# Altium project ESP32_F.PrjPcb
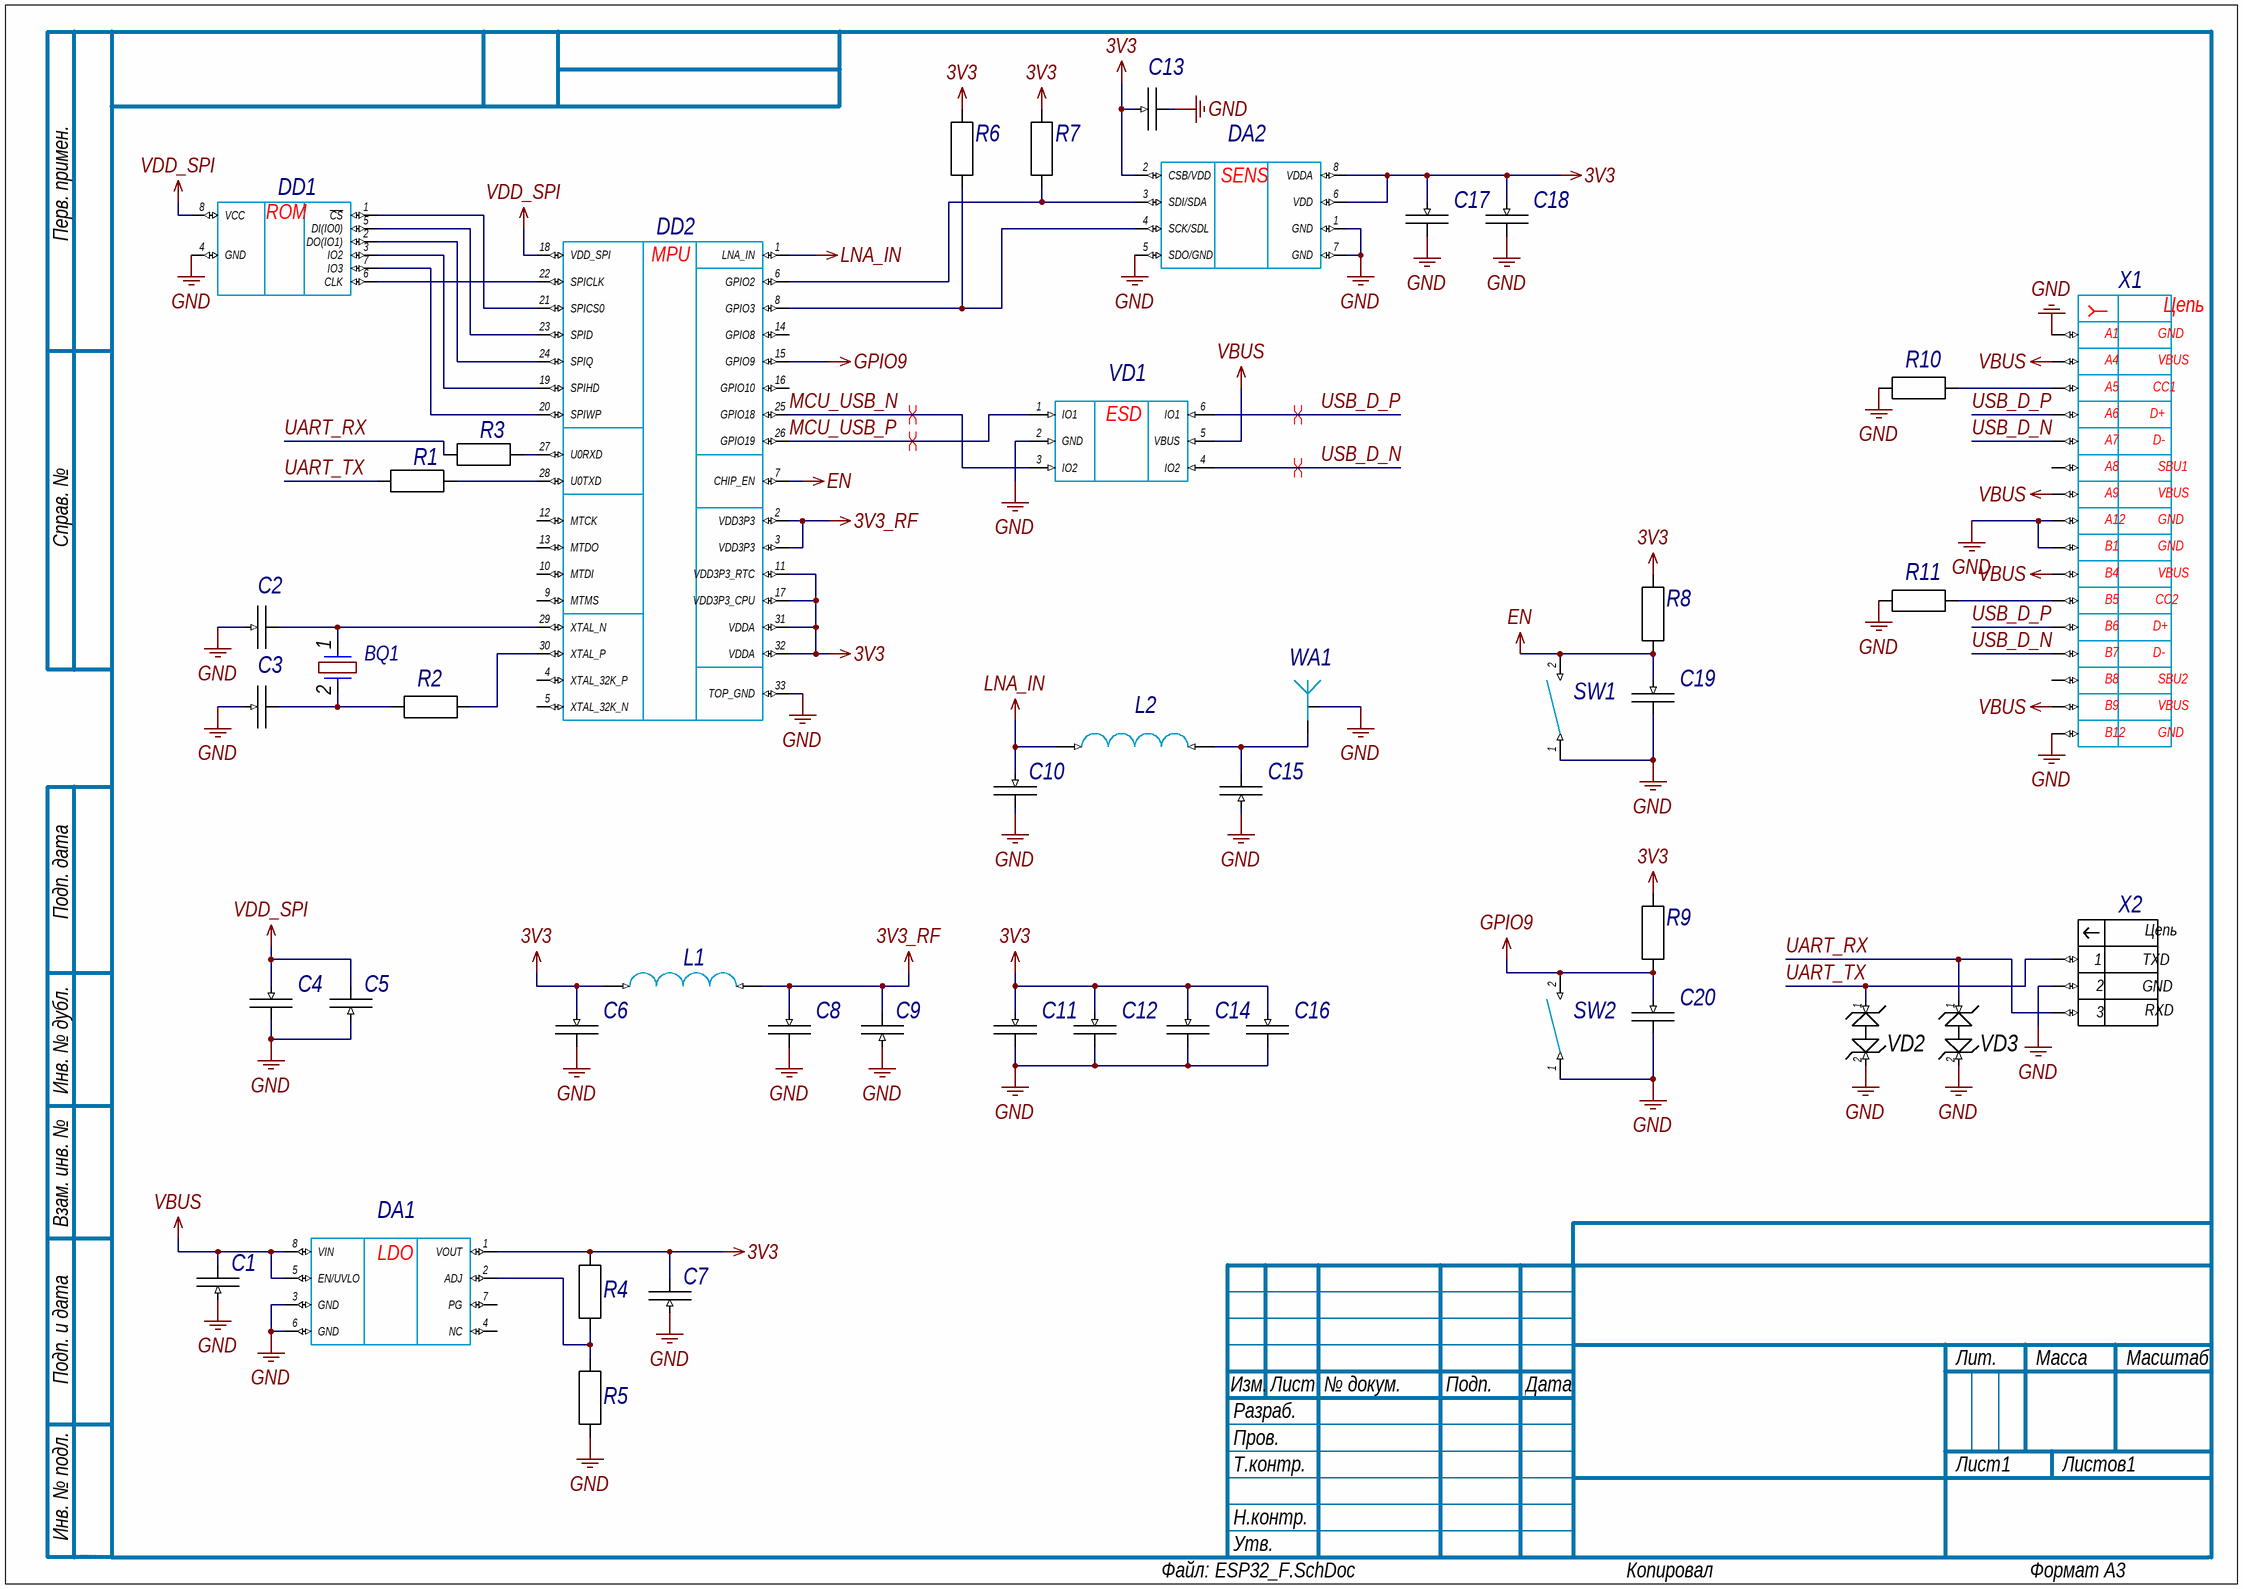
[diagram p0: ESP32_F.SchDoc]
1 sheet, 46 parts. Net scope: global (net labels, ports and power ports of the same name join across sheets).
Board file: ESP32_F.PcbDoc

## Sheet ESP32_F.SchDoc
size 420 x 297 mm; Author: ALTIUM GOSTBOM2.0 KEV; SheetNumber: 1; SheetTotal: 1

### Parts
BQ1  ABM3-40.000MHZ-B2-T  [ABM3]  (value not drawn)
C1  C_0402  [C_0402]  (value not drawn)
C2  C_0402  [C_0402]  (value not drawn)
C3  C_0402  [C_0402]  (value not drawn)
C4  C_0402  [C_0402]  (value not drawn)
C5  C_0805  [C_0805]  (value not drawn)
C6  C_0402  [C_0402]  (value not drawn)
C7  C_0402  [C_0402]  (value not drawn)
C8  C_0402  [C_0402]  (value not drawn)
C9  C_0805  [C_0805]  (value not drawn)
C10  C_0402  [C_0402]  (value not drawn)
C11  C_0402  [C_0402]  (value not drawn)
C12  C_0402  [C_0402]  (value not drawn)
C13  C_0402  [C_0402]  (value not drawn)
C14  C_0402  [C_0402]  (value not drawn)
C15  C_0402  [C_0402]  (value not drawn)
C16  C_0402  [C_0402]  (value not drawn)
C17  C_0402  [C_0402]  (value not drawn)
C18  C_0402  [C_0402]  (value not drawn)
C19  C_0402  [C_0402]  (value not drawn)
C20  C_0402  [C_0402]  (value not drawn)
DA1  ADP7104ACPZ-R7  [SON50P300X300X80-9N-D]  (value not drawn)
DA2  BME680  [LGA-8]  (value not drawn)
DD1  W25Q64JVSSIQ  [SOIC127P790X216-8N]  (value not drawn)
DD2  ESP32-C3  [QFN50P500X500X90-33N-D]  (value not drawn)
L1  L_0805  [L_0402]  (value not drawn)
L2  L_0402  [L_0402]  (value not drawn)
R1  R_0402  [R_0402]  (value not drawn)
R2  R_0402  [R_0402]  (value not drawn)
R3  R_0402  [R_0402]  (value not drawn)
R4  R_0402  [R_0402]  (value not drawn)
R5  R_0402  [R_0402]  (value not drawn)
R6  R_0402  [R_0402]  (value not drawn)
R7  R_0402  [R_0402]  (value not drawn)
R8  R_0402  [R_0402]  (value not drawn)
R9  R_0402  [R_0402]  (value not drawn)
R10  R_0402  [R_0402]  (value not drawn)
R11  R_0402  [R_0402]  (value not drawn)
SW1  DS04-254-2-01BK-SMT-TR  [DS04-254-2-01BK-SMT-TR]  (value not drawn)
SW2  DS04-254-2-01BK-SMT-TR  [DS04-254-2-01BK-SMT-TR]  (value not drawn)
VD1  USBLC6-2SC6  [SOT95P280X145-6N]  (value not drawn)
VD2  TPD1E10B06DPY  [TPD1E10B06DPYR]  (value not drawn)
VD3  TPD1E10B06DPY  [TPD1E10B06DPYR]  (value not drawn)
WA1  IFA  [F_antenna]  (value not drawn)
X1  GSB1C41110SSHR  [GSB1C41110SSHR]  (value not drawn)
X2  3pin_JST  [BM03BSRSSTB]  (value not drawn)

### Nets
3V3: C6.1 C7.2 C11.1 C12.1 C13.1 C14.1 C16.1 C17.1 C18.1 DA1.1(VOUT) DA2.2(CSB/VDD) DA2.6(VDD) DA2.8(VDDA) DD2.11(VDD3P3_RTC) DD2.17(VDD3P3_CPU) DD2.31(VDDA) DD2.32(VDDA) L1.1 R4.2 R6.1 R7.1 R8.1 R9.1
3V3_RF: C8.1 C9.2 DD2.2(VDD3P3) DD2.3(VDD3P3) L1.2
EN: C19.1 DD2.7(CHIP_EN) R8.2 SW1.2
GND: C1.1 C2.1 C3.1 C4.2 C5.1 C6.2 C7.1 C8.2 C9.1 C10.2 C11.2 C12.2 C13.2 C14.2 C15.1 C16.2 C17.2 C18.2 C19.2 C20.2 DA1.3(GND) DA1.6(GND) DA2.1(GND) DA2.5(SDO/GND) DA2.7(GND) DD1.4(GND) DD2.33(TOP_GND) R5.1 R10.2 R11.2 SW1.1 SW2.1 VD1.2(GND) VD2.2 VD3.2 WA1.2(GND) X1.A1(GND) X1.A12(GND) X1.B1(GND) X1.B12(GND) X2.2(GND)
GPIO9: C20.1 DD2.15(GPIO9) R9.2 SW2.2
LNA_IN: C10.1 DD2.1(LNA_IN) L2.1
VBUS: C1.2 DA1.5(EN/UVLO) DA1.8(VIN) VD1.5(VBUS) X1.A4(VBUS) X1.A9(VBUS) X1.B4(VBUS) X1.B9(VBUS)
VDD_SPI: C4.1 C5.2 DD1.8(VCC) DD2.18(VDD_SPI)
MCU_USB_N: DD2.25(GPIO18) VD1.3(IO2)
MCU_USB_P: DD2.26(GPIO19) VD1.1(IO1)
UART_RX: R3.1 VD3.1 X2.3(RXD)
UART_TX: R1.1 VD2.1 X2.1(TXD)
USB_D_N: VD1.4(IO2) X1.A7(D-) X1.B7(D-)
USB_D_P: VD1.6(IO1) X1.A6(D+) X1.B6(D+)
NetBQ1_1: BQ1.1 C2.2 DD2.29(XTAL_N)
NetBQ1_2: BQ1.2 C3.2 R2.1
NetC15_2: C15.2 L2.2 WA1.1
NetDA1_2: DA1.2(ADJ) R4.1 R5.2
NetDA2_3: DA2.3(SDI/SDA) DD2.6(GPIO2) R7.2
NetDA2_4: DA2.4(SCK/SDL) DD2.8(GPIO3) R6.2
NetDD1_1: DD1.1(~{CS}) DD2.21(SPICS0)
NetDD1_2: DD1.2(DO(IO1)) DD2.24(SPIQ)
NetDD1_3: DD1.3(IO2) DD2.19(SPIHD)
NetDD1_5: DD1.5(DI(IO0)) DD2.23(SPID)
NetDD1_6: DD1.6(CLK) DD2.22(SPICLK)
NetDD1_7: DD1.7(IO3) DD2.20(SPIWP)
NetDD2_27: DD2.27(U0RXD) R3.2
NetDD2_28: DD2.28(U0TXD) R1.2
NetDD2_30: DD2.30(XTAL_P) R2.2
NetR10_1: R10.1 X1.A5(CC1)
NetR11_1: R11.1 X1.B5(CC2)

Not connected (* = marked no-connect by the designer): DA1 4(NC) 7(PG); DD2 4(XTAL_32K_P) 5(XTAL_32K_N) 9(MTMS) 10(MTDI) 12(MTCK) 13(MTDO) 14(GPIO8) 16(GPIO10); X1 A8(SBU1) B8(SBU2)

### Layout directives
differential pair: MCU_USB_N, MCU_USB_P, USB_D_N, USB_D_P

### Notes on the sheet
- Перв. примен.
- Справ. №
- Подп. дата
- Инв. № дубл.
- Взам. инв. №
- Подп. и дата
- Изм.
- Разраб.
- Лист
- № докум.
- Подп.
- Дата
- Лит.
- Масса
- Масштаб
- Пров.
- Т.контр.
- Листов
- Инв. № подл.
- Н.контр.
- Утв.
- ALTIUM GOSTBOM2.0 KEV
- Файл:
- Копировал
- Формат А3
- (in symbol 3pin_JST) Цепь
- (in symbol ADP7104ACPZ-R7) LDO
- (in symbol BME680) SENS
- (in symbol ESP32-C3) MPU
- (in symbol GSB1C41110SSHR) Цепь
- (in symbol USBLC6-2SC6) ESD
- (in symbol W25Q64JVSSIQ) ROM

### Library data of the parts
BQ1 = ABM3-40.000MHZ-B2-T: Crystal or Oscillator; Manufacturer_Name: ABRACON; Datasheet Link: https://abracon.com/Resonators/abm3.pdf; Height: 1.3mm; Manufacturer_Part_Number: ABM3-40.000MHZ-B2-T
C1 C7 = C_0402: Capacitor generic 0402 smd; Manufacturer: Kyecera AVX; Part_number: CM105X7R105K25AT; Tolerance: 10; Voltage_rating: 25; Dielecric: X7R; Value: 1uF; Package_size: 0402
C2 C3 = C_0402: Capacitor generic 0402 smd; Manufacturer: Murata; Part_number: GJM0225C1C220GB01L; Tolerance: 2%; Voltage_rating: 16; Dielecric: C0G(NP0); Value: 22pF; Package_size: 0402
C4 C6 C8 C11-C14 C16-C20 = C_0402: Capacitor generic 0402 smd; Manufacturer: Yageo; Part_number: AC0402KRX7R8BB104; Tolerance: 10; Voltage_rating: 25; Dielecric: X7R; Value: 100nF; Package_size: 0402
C5 C9 = C_0805: Capacitor generic 0805 smd; Manufacturer: Yageo; Part_number: CC0805KKX7R7BB106; Tolerance: 10; Voltage_rating: 16; Dielecric: X7R; Value: 10uF; Package_size: 0805
C10 = C_0402: Capacitor generic 0402 smd; Manufacturer: Murata; Part_number: GJM0225C1E5R0BB01L; Tolerance: 0.1pF; Voltage_rating: 25; Dielecric: C0G(NP0); Value: 5pF; Package_size: 0402
C15 = C_0402: Capacitor generic 0402 smd; Manufacturer: Murata; Part_number: GJM0225C1E4R0BB01L; Tolerance: 0.1pF; Voltage_rating: 25; Dielecric: C0G(NP0); Value: 4pF; Package_size: 0402
DA1 = ADP7104ACPZ-R7: CMOS LDO 500mA / input V 3.3V - 20V / output V 1.5 -9 V; Manufactur: Analog Devices; Part_number: ADP7104ACPZ-R7
DA2 = BME680: Low power gas, pressure, temperature & humidity / sensor; Manufacturer: Bosch; Parameter 2: BME680
DD1 = W25Q64JVSSIQ: NOR Flash (SPI, Dual SPI, Quad SPI); Manufacturer: Winbond Electronics; Part_number: W25Q64JVSSIQ
DD2 = ESP32-C3: MCU (SoC) with wifi & bluetooth support; Manufacturer: Espressif; Part_number: ESP32-C3
L1 = L_0805: induction 0805 smd; Manufacturer: Murata; Part_number: LQW15AN2N2C10D; Tolerance: 0.2nH; Current_rating: 1A; Value: 2n2; Package_size: 0402; Q-factor: *
L2 = L_0402: induction  0402 smd; Manufacturer: Murata; Part_number: LQG15HN1N8B02D; Tolerance: 0.1 nH; Value: 1n8; Package_size: 0402; Current_rating: *; Q-factor: *
R1 = R_0402: SMD 0402 resistor generic; Manufactur: Yageo; Part_number: RC0402FR-07470RL; Tolerance: 1; Value: 470; Package_size: 0402; Voltage_rating: *
R2 = R_0402: SMD 0402 resistor generic; Value: 22; Manufactur: *; Part_number: *; Package_size: *; Tolerance: *; Voltage_rating: *
R3 = R_0402: SMD 0402 resistor generic; Value: 470; Manufactur: *; Part_number: *; Package_size: *; Tolerance: *; Voltage_rating: *
R4 = R_0402: SMD 0402 resistor generic; Manufactur: Yageo; Part_number: RC0402FR-0747KL; Tolerance: 1; Value: 47k; Package_size: 0402; Voltage_rating: *
R5 = R_0402: SMD 0402 resistor generic; Manufactur: Yageo; Part_number: RC0402FR-0727KL; Tolerance: 1; Value: 27k; Package_size: 0402; Voltage_rating: *
R6 R7 = R_0402: SMD 0402 resistor generic; Manufactur: Yageo; Part_number: RC0402FR-074K7L; Tolerance: 1; Value: 4.7k; Package_size: 0402; Voltage_rating: *
R8-R11 = R_0402: SMD 0402 resistor generic; Value: 5.1kOhm; Manufactur: *; Part_number: *; Package_size: *; Tolerance: *; Voltage_rating: *
VD1 = USBLC6-2SC6: Manufacturer: STMicroelectronics; Part_number: USBLC6-2SC6
VD2 VD3 = TPD1E10B06DPY: ESD Protection Diode in 0402 Package; Manufacturer: *; Part_number: *; Min Breakdown Voltage: *
WA1 = IFA: IFA 2.4 GHz
X1 = GSB1C41110SSHR: USB-C GSB1C41110SSHR; Manufacturer: *; Part_number: *
X2 = 3pin_JST: Header 3 pin; Manufacurer: *; Part_number: *
SW1 SW2 = DS04-254-2-01BK-SMT-TR: Manufacturer: *; Part_number: *